# Altium schematic sheet MCU.SchDoc
size A2; SheetNumber: 3; SheetTotal: 4
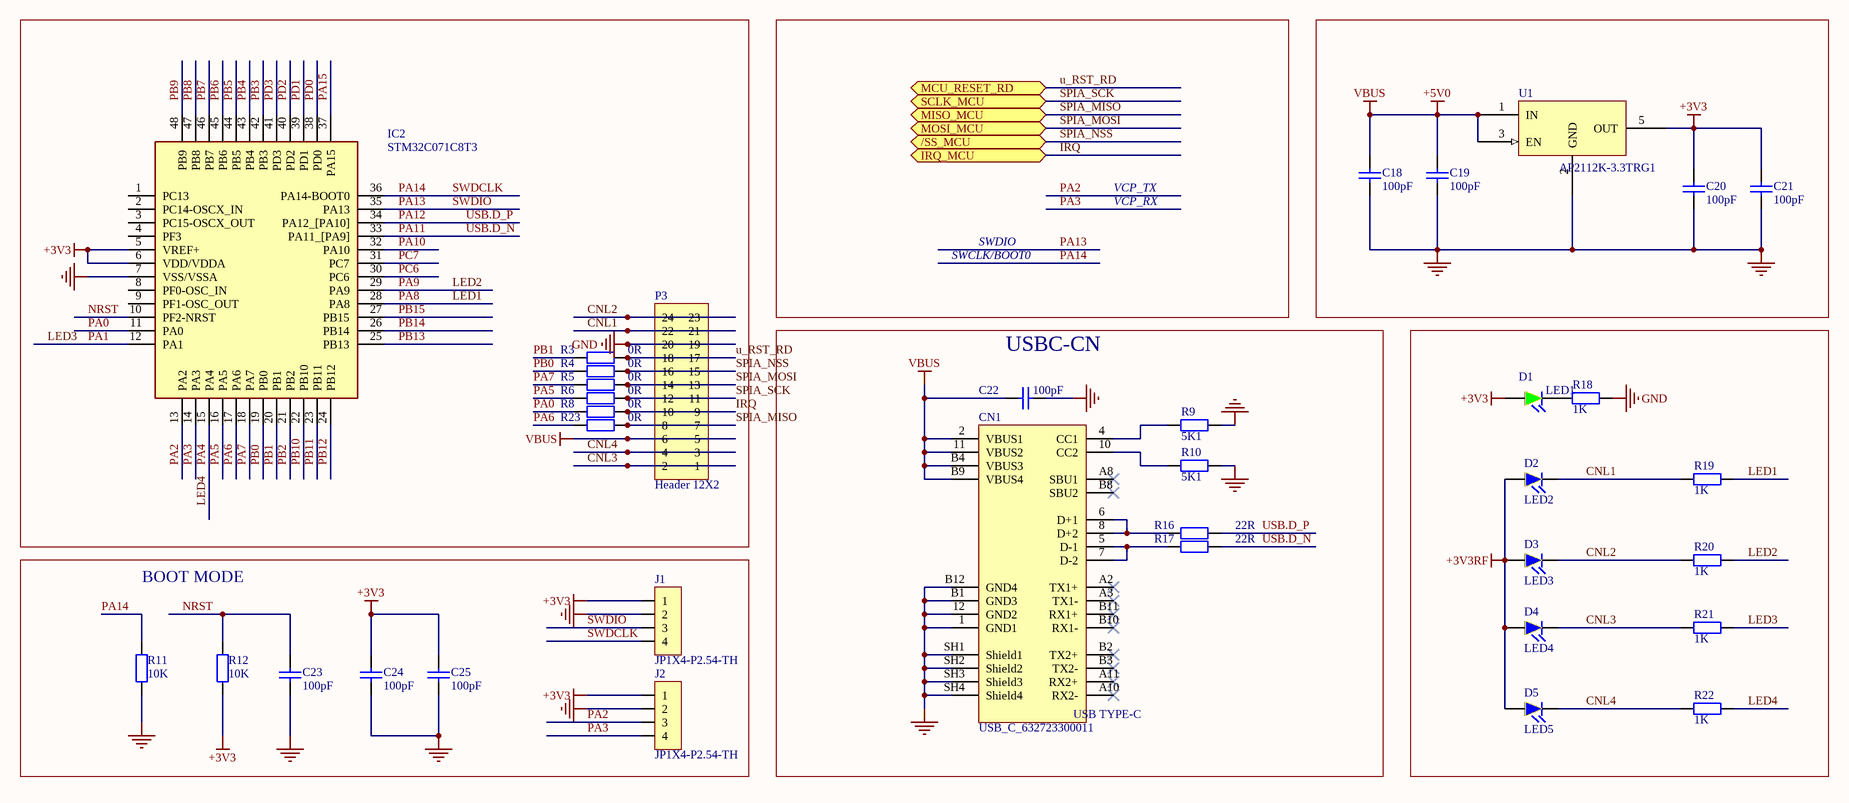
[diagram p0: MCU.SchDoc]

## Parts
C18  value 100pF  [CAP_CERAMIC_0603(1608mm)]  (hidden comment: Capacitor)
C19  value 100pF  [CAP_CERAMIC_0603(1608mm)]  (hidden comment: Capacitor)
C20  value 100pF  [CAP_CERAMIC_0603(1608mm)]  (hidden comment: Capacitor)
C21  value 100pF  [CAP_CERAMIC_0603(1608mm)]  (hidden comment: Capacitor)
C22  value 100pF  [CAP_CERAMIC_0603(1608mm)]  (hidden comment: Capacitor)
C23  value 100pF  [CAP_CERAMIC_0603(1608mm)]  (hidden comment: Capacitor)
C24  value 100pF  [CAP_CERAMIC_0603(1608mm)]  (hidden comment: Capacitor)
C25  value 100pF  [CAP_CERAMIC_0603(1608mm)]  (hidden comment: Capacitor)
CN1  USB_C_632723300011  [CON_USB-TYPEC_WE_632723300011]
D1  LED1  [0805_Pol]
D2  LED2  [LED-2.54]
D3  LED3  [LED-2.54]
D4  LED4  [LED-2.54]
D5  LED5  [LED-2.54]
IC2  STM32C071C8T3  [QFP50P900X900X160-48N]
J1  JP1X4-P2.54-TH  [HDR1X4]
J2  JP1X4-P2.54-TH  [HDR1X4]
P3  Header 12X2  [HDR2X12]
R3  0R  [RES_0603(1608)]
R4  0R  [RES_0603(1608)]
R5  0R  [RES_0603(1608)]
R6  0R  [RES_0603(1608)]
R8  0R  [RES_0603(1608)]
R9  5K1  [RES_0603(1608)]
R10  5K1  [RES_0603(1608)]
R11  10K  [RES_0603(1608)]
R12  10K  [RES_0603(1608)]
R16  22R  [RES_0603(1608)]
R17  22R  [RES_0603(1608)]
R18  1K  [RES_0603(1608)]
R19  1K  [RES_0603(1608)]
R20  1K  [RES_0603(1608)]
R21  1K  [RES_0603(1608)]
R22  1K  [RES_0603(1608)]
R23  0R  [RES_0603(1608)]
U1  AP2112K-3.3TRG1  [SOT23-5]

## Blocks framed on the sheet
USBC-CN: C22 CN1 R9 R10 R16 R17
BOOT MODE: C23-C25 J1 J2 R11 R12

## Ports
/SS_MCU (bidir, see STM32C0_ST25R100_EVK[2B], Sheet[1C]), IRQ_MCU (bidir, see STM32C0_ST25R100_EVK[2B], Sheet[1C]), MCU_RESET_RD (bidir, see STM32C0_ST25R100_EVK[2B], Sheet[1B]), MISO_MCU (bidir, see STM32C0_ST25R100_EVK[2B], Sheet[1C]), MOSI_MCU (bidir, see STM32C0_ST25R100_EVK[2B], Sheet[1C]), SCLK_MCU (bidir, see STM32C0_ST25R100_EVK[2B], Sheet[1C])

## Nets
+3V3: C20.2 C21.2 C24.2 C25.2 D1.1(A) IC2.5(VREF+) IC2.6(VDD/VDDA) J1.1 J2.1 R12.1 U1.5(OUT)
+3V3RF: D2.1(A) D3.1(A) D4.1(A) D5.1(A)
+5V0: C18.2 C19.2 C22.1 CN1.2(VBUS1) CN1.11(VBUS2) CN1.B4(VBUS3) CN1.B9(VBUS4) P3.5 P3.6 U1.1(IN) U1.3(EN)  [also labelled VBUS]
GND: C18.1 C19.1 C20.1 C21.1 C22.2 C23.1 C24.1 C25.1 CN1.1(GND1) CN1.12(GND2) CN1.B1(GND3) CN1.B12(GND4) CN1.SH1(Shield1) CN1.SH2(Shield2) CN1.SH3(Shield3) CN1.SH4(Shield4) IC2.7(VSS/VSSA) J1.2 J2.2 P3.19 P3.20 R9.1 R10.1 R11.1 R18.1 U1.2(GND)
CNL1: D2.2(K) P3.21 P3.22 R19.2
CNL2: D3.2(K) P3.23 P3.24 R20.2
CNL3: D4.2(K) P3.1 P3.2 R21.2
CNL4: D5.2(K) P3.3 P3.4 R22.2
IRQ: P3.9 P3.10 R8.2 ; port IRQ_MCU
LED1: IC2.28(PA8) R19.1  [also labelled PA8]
LED2: IC2.29(PA9) R20.1  [also labelled PA9]
LED3: IC2.12(PA1) R21.1  [also labelled PA1]
LED4: IC2.15(PA4) R22.1  [also labelled PA4]
NRST: C23.2 IC2.10(PF2-NRST) R12.2
PA0: IC2.11(PA0) R8.1
PA2: IC2.13(PA2) J2.3
PA3: IC2.14(PA3) J2.4
PA5: IC2.16(PA5) R6.1
PA6: IC2.17(PA6) R23.1
PA7: IC2.18(PA7) R5.1
PA10: IC2.32(PA10)
PA11: IC2.33(PA11_[PA9]) R17.1  [also labelled USB.D_N]
PA12: IC2.34(PA12_[PA10]) R16.1  [also labelled USB.D_P]
PA13: IC2.35(PA13) J1.3  [also labelled SWDIO]
PA14: IC2.36(PA14-BOOT0) J1.4 R11.2  [also labelled SWDCLK]
PA15: IC2.37(PA15)
PB0: IC2.19(PB0) R4.1
PB1: IC2.20(PB1) R3.1
PB2: IC2.21(PB2)
PB3: IC2.42(PB3)
PB4: IC2.43(PB4)
PB5: IC2.44(PB5)
PB6: IC2.45(PB6)
PB7: IC2.46(PB7)
PB8: IC2.47(PB8)
PB9: IC2.48(PB9)
PB10: IC2.22(PB10)
PB11: IC2.23(PB11)
PB12: IC2.24(PB12)
PB13: IC2.25(PB13)
PB14: IC2.26(PB14)
PB15: IC2.27(PB15)
PC6: IC2.30(PC6)
PC7: IC2.31(PC7)
PD0: IC2.38(PD0)
PD1: IC2.39(PD1)
PD2: IC2.40(PD2)
PD3: IC2.41(PD3)
SPIA_MISO: P3.7 P3.8 R23.2 ; port MISO_MCU
SPIA_MOSI: P3.13 P3.14 R5.2 ; port MOSI_MCU
SPIA_NSS: P3.15 P3.16 R4.2 ; port /SS_MCU
SPIA_SCK: P3.11 P3.12 R6.2 ; port SCLK_MCU
u_RST_RD: P3.17 P3.18 R3.2 ; port MCU_RESET_RD
NetCN1_4: CN1.4(CC1) R9.2
NetCN1_5: CN1.5(D-1) CN1.7(D-2) R17.2
NetCN1_6: CN1.6(D+1) CN1.8(D+2) R16.2
NetCN1_10: CN1.10(CC2) R10.2
NetD1_2: D1.2(K) R18.2

Not connected (* = marked no-connect by the designer): CN1 A2(TX1+)* A3(TX1-)* A8(SBU1)* A10(RX2-)* A11(RX2+)* B2(TX2+)* B3(TX2-)* B8(SBU2)* B10(RX1-)* B11(RX1+)*; IC2 1(PC13) 2(PC14-OSCX_IN) 3(PC15-OSCX_OUT) 4(PF3) 8(PF0-OSC_IN) 9(PF1-OSC_OUT)

## Notes on the sheet
- SWDIO
- VCP_TX
- VCP_RX
- SWCLK/BOOT0
- (in symbol MCD-02273) USB TYPE-C

## Library data of the parts
C18-C25 = MCD-00205: Capacitor, MLCC, 100pF, 50V, NPO, +/-5%, 0402, T=0.5mm; Part_Preference: Recommended; Manufacturer: YAGEO; Manufacturer_Part_Number: CC0402JRNPO9BN101; Component_Country_Of_Origin: China; ShowFields: YES; ID: 2658; Internal_Part_Number: MCD-00205; Status: Released; Part_Type: Capacitor; Package: 0402; ComponentLink1URL: http://tunmcdsvn.tun.st.com/Component_Documentation_Library/Trunk/Capacitor/YAGEO_NP0_Series; Order_Code_Digikey: 311-1024-1-ND; Order_Code_Farnell: 3019226RL; Order_Code_RS: N/A
CN1 = MCD-02273: Connector_USB_TypeC, 24pins, RA, TH, T=1.9mm (USB certified); Part_Preference: Recommended; Manufacturer: WURTH ELEKTRONIK; Component_Country_Of_Origin: China; ShowFields: YES; ID: 4373; Internal_Part_Number: MCD-02273; Value: USB_C_632723300011; Status: Released; Part_Type: Connector; Manufacturer_Part_Number: 632723300011; ComponentLink1URL: http://tunmcdsvn.tun.st.com/Component_Datasheet_Library/Trunk/Connectors/WURTH_ELEKTRONIK_USB_TYPE-C_632723300011; Order_Code_Digikey: 732-9618-1-ND; Order_Code_Farnell: 2984404; Order_Code_RS: N/A
D1 = LED_Gr: LED 0805 GREEN 6.3MCD GAP ON GAP; Package: 0805; Parameter 1: *
D2-D5 = LED_BLUE: LED 3MM HI EFF BLUE DIFF; MFR: Vishay Semiconductor Opto Division; Part Number: TLHB4400; Vender Part: 751-1092-ND; Vender: Digikey; Package: Pitch:3mm; Eposi Code: *; Parameter 1: *
IC2 = STM32C071C8T3: Integrated Circuit; Manufacturer_Name: STMicroelectronics; Datasheet Link: https://www.st.com/resource/en/datasheet/stm32c071c8.pdf; Height: 1.6mm; Manufacturer_Part_Number: STM32C071C8T3
J1 J2 = JP1X4-P2.54-TH: Pin Header Single Row 2.54MM 4P - Through Hole
P3 = Header 12X2: Header, 12-Pin, Dual row; LatestRevisionDate: 17-Jul-2002; LatestRevisionNote: Re-released for DXP Platform.; Publisher: Altium Limited
R3-R6 R8-R12 R23 = R0603: Resistor SMD 0603(1608); MPN: RC0603FR-070RL; Package: 0603
  R3-R6 R8 R23: Value: 0R
  R9 R10: Value: 5K1
  R11 R12: Value: 10K
R16 R17 = R0603: Resistor SMD 0603(1608); MPN: RC0603FR-070RL; Value: 5K1; Package: 0603
R18-R22 = RC0603FR-0710KL: RES SMD 10K OHM 1% 1/10W 0603; Solder: SMT; Value: 1K; MPN: RC0603FR-0710KL; Parameter 1: *
U1 = AP2112K-3.3TRG1: IC REG LDO 3.3V 0.6A SOT25; CompanyID: VT-01101; Solder: SMT; MPN: AP2112K-3.3TRG1; Value: AP2112K-3.3TRG1